# Altium schematic sheet STPMotorConnections.SchDoc
size A4; SheetNumber: 1; SheetTotal: 6
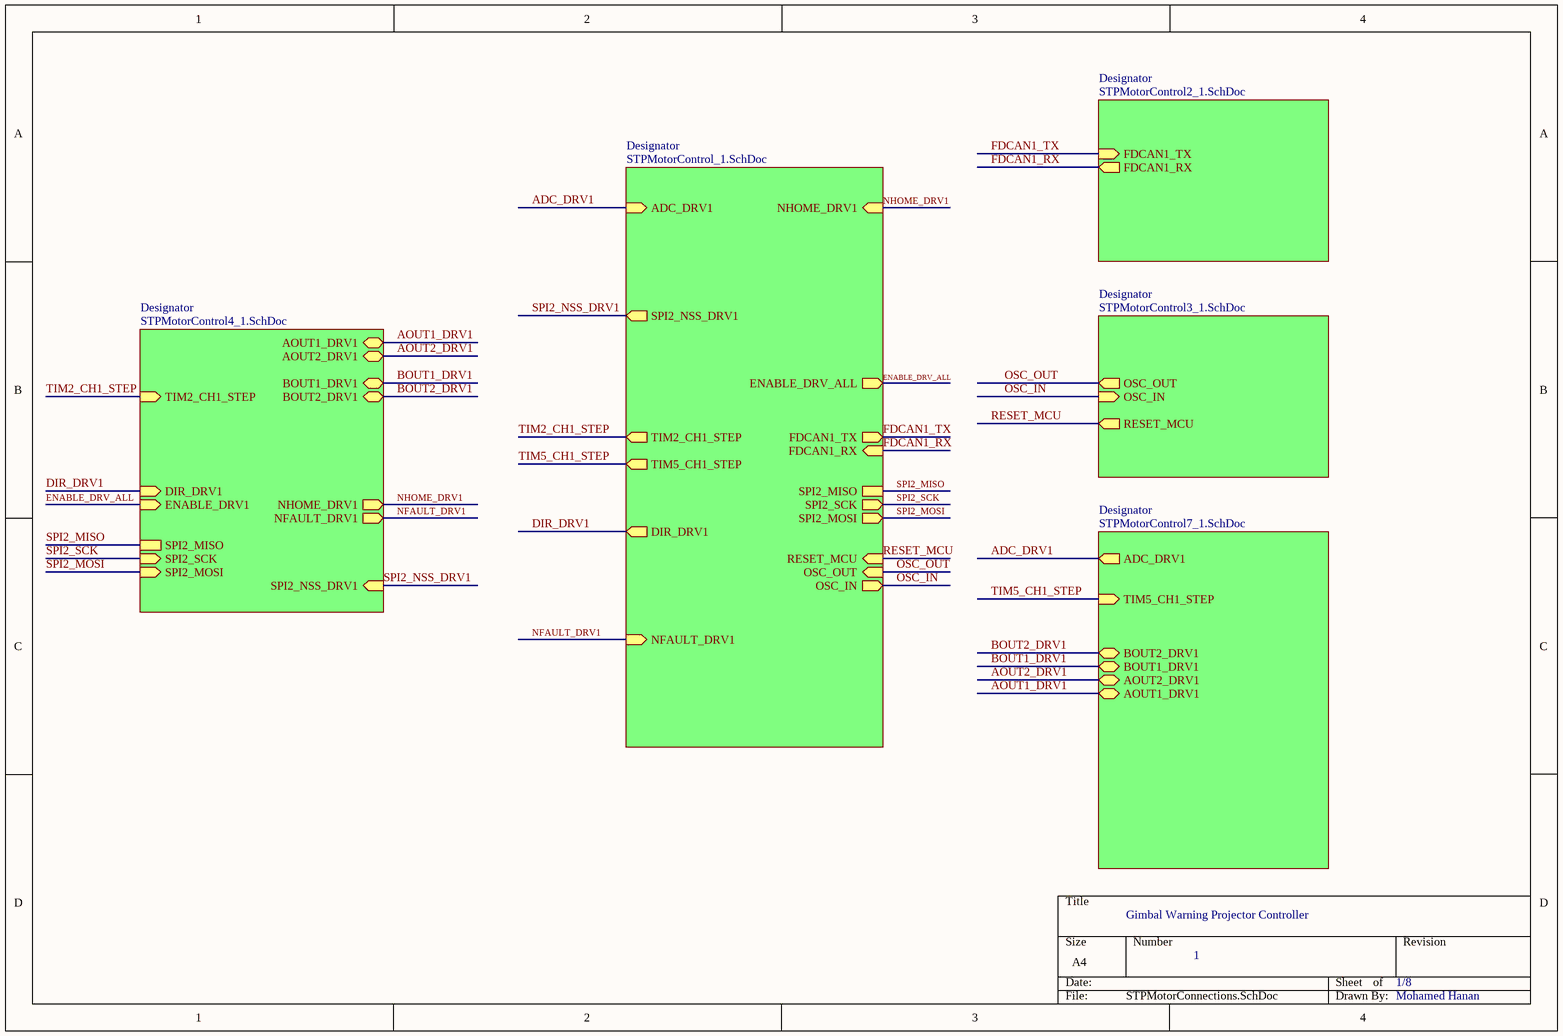
[diagram p0: STPMotorConnections.SchDoc]

## Sub-sheets
Designator = STPMotorControl_1.SchDoc: TIM2_CH1_STEP (out), TIM5_CH1_STEP (out), DIR_DRV1 (out), NFAULT_DRV1 (in), NHOME_DRV1 (in), ENABLE_DRV_ALL (out), FDCAN1_TX (out), FDCAN1_RX (in), SPI2_MISO, SPI2_SCK (out), SPI2_MOSI (out), RESET_MCU (in), OSC_OUT (in), OSC_IN (out), ADC_DRV1 (in), SPI2_NSS_DRV1 (out)
Designator = STPMotorControl2_1.SchDoc: FDCAN1_TX (in), FDCAN1_RX (out)
Designator = STPMotorControl3_1.SchDoc: OSC_OUT (out), OSC_IN (in), RESET_MCU (out)
Designator = STPMotorControl4_1.SchDoc: AOUT1_DRV1 (bidir), AOUT2_DRV1 (bidir), BOUT1_DRV1 (bidir), BOUT2_DRV1 (bidir), NHOME_DRV1 (out), NFAULT_DRV1 (out), SPI2_MISO, SPI2_SCK (in), SPI2_MOSI (in), DIR_DRV1 (in), ENABLE_DRV1 (in), TIM2_CH1_STEP (in), SPI2_NSS_DRV1 (in)
Designator = STPMotorControl7_1.SchDoc: BOUT2_DRV1 (bidir), BOUT1_DRV1 (bidir), AOUT2_DRV1 (bidir), AOUT1_DRV1 (bidir), ADC_DRV1 (out), TIM5_CH1_STEP (in)

## Nets
ADC_DRV1: sheet Designator/ADC_DRV1, sheet Designator/ADC_DRV1
AOUT1_DRV1: sheet Designator/AOUT1_DRV1, sheet Designator/AOUT1_DRV1
AOUT2_DRV1: sheet Designator/AOUT2_DRV1, sheet Designator/AOUT2_DRV1
BOUT1_DRV1: sheet Designator/BOUT1_DRV1, sheet Designator/BOUT1_DRV1
BOUT2_DRV1: sheet Designator/BOUT2_DRV1, sheet Designator/BOUT2_DRV1
DIR_DRV1: sheet Designator/DIR_DRV1, sheet Designator/DIR_DRV1
ENABLE_DRV_ALL: sheet Designator/ENABLE_DRV_ALL, sheet Designator/ENABLE_DRV1
FDCAN1_RX: sheet Designator/FDCAN1_RX, sheet Designator/FDCAN1_RX
FDCAN1_TX: sheet Designator/FDCAN1_TX, sheet Designator/FDCAN1_TX
NFAULT_DRV1: sheet Designator/NFAULT_DRV1, sheet Designator/NFAULT_DRV1
NHOME_DRV1: sheet Designator/NHOME_DRV1, sheet Designator/NHOME_DRV1
OSC_IN: sheet Designator/OSC_IN, sheet Designator/OSC_IN
OSC_OUT: sheet Designator/OSC_OUT, sheet Designator/OSC_OUT
RESET_MCU: sheet Designator/RESET_MCU, sheet Designator/RESET_MCU
SPI2_MISO: sheet Designator/SPI2_MISO, sheet Designator/SPI2_MISO
SPI2_MOSI: sheet Designator/SPI2_MOSI, sheet Designator/SPI2_MOSI
SPI2_NSS_DRV1: sheet Designator/SPI2_NSS_DRV1, sheet Designator/SPI2_NSS_DRV1
SPI2_SCK: sheet Designator/SPI2_SCK, sheet Designator/SPI2_SCK
TIM2_CH1_STEP: sheet Designator/TIM2_CH1_STEP, sheet Designator/TIM2_CH1_STEP
TIM5_CH1_STEP: sheet Designator/TIM5_CH1_STEP, sheet Designator/TIM5_CH1_STEP

## Notes on the sheet
- Gimbal Warning Projector Controller
- 1
- 1/8
- Mohamed Hanan